# Altium schematic sheet BUCK_unvalidated.SchDoc
size A0; SheetNumber: 2; SheetTotal: 2
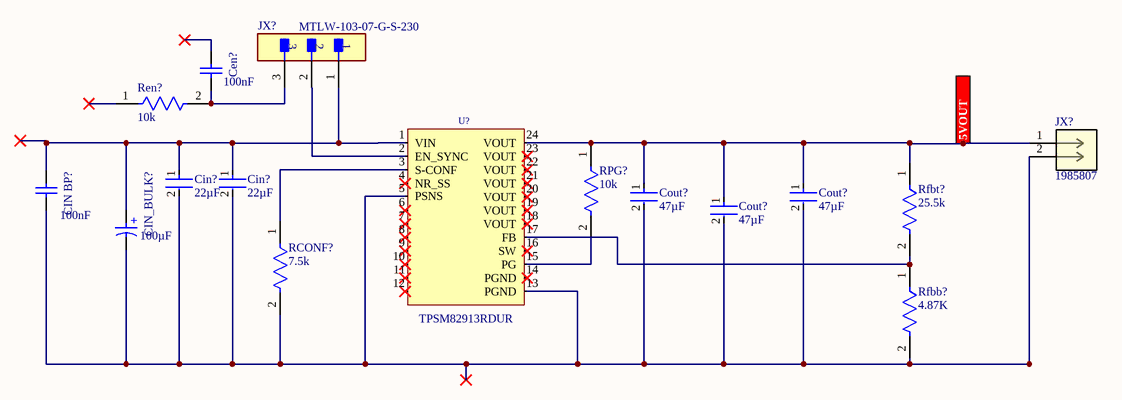
[diagram p0: BUCK_unvalidated.SchDoc]

## Parts
(Parts that share a designator on the sheet are numbered #1, #2 ... from top to bottom, then left to right.)
Cen?  value 100nF  [WCAP-CSGP_0603_L1.6W0.8H0.8_Reflow]  (hidden comment: 885012206095)
Cin?#1  value 22µF  [FP-GRM21B-0_2-e0_2_0_7-MFG]  (hidden comment: GRM21BR61E226ME44L)
Cin?#2  value 22µF  [FP-GRM21B-0_2-e0_2_0_7-MFG]  (hidden comment: GRM21BR61E226ME44L)
CIN_BP?  value 100nF  [WCAP-CSGP_0603_L1.6W0.8H0.8_Reflow]  (hidden comment: 885012206095)
CIN_BULK?  value 100µF  [WCAP-ASLL_D6.3H7.7]  (hidden comment: 865060445005)
Cout?#1  value 47µF  [FP-GRM21B-0_2-e0_2_0_7-MFG]  (hidden comment: GRM21BR61A476ME15L)
Cout?#2  value 47µF  [FP-GRM21B-0_2-e0_2_0_7-MFG]  (hidden comment: GRM21BR61A476ME15L)
Cout?#3  value 47µF  [FP-GRM21B-0_2-e0_2_0_7-MFG]  (hidden comment: GRM21BR61A476ME15L)
JX?#1  MTLW-103-07-G-S-230  [FP-MTLW-103-07-G-S-230-MFG]
JX?#2  1985807  [CONN_1751248_PXC]
RCONF?  value 7.5k  [FP-CRCW0805-HPe3-MFG]  (hidden comment: CRCW08057K50FKEA)
Ren?  value 10k  [FP-CRCW0805-e3-MFG]  (hidden comment: CRCW080510K0FKEA)
Rfbb?  value 4.87K  [FP-CRCW0805-e3-MFG]  (hidden comment: RC0805FR-074K87L)
Rfbt?  value 25.5k  [FP-CRCW0805-e3-MFG]  (hidden comment: CRCW080525K5FKEA)
RPG?  value 10k  [FP-CRCW0805-e3-MFG]  (hidden comment: CRCW080510K0FKEA)
U?  TPSM82913RDUR  [B0QFN28_RDU_TEX]

## Ports
5VOUT

## Nets
5VOUT: Cout?#1.1 Cout?#2.1 Cout?#3.1 JX?#2.1 Rfbt?.1 RPG?.1 U?.24(VOUT) ; port 5VOUT
NetCen?_2: Cen?.2 JX?#1.3 Ren?.2
NetCin?#1_1: Cin?#1.1 Cin?#2.1 CIN_BP?.1 CIN_BULK?.1(P) JX?#1.1 U?.1(VIN)
NetCin?#1_2: Cin?#1.2 CIN_BP?.2 CIN_BULK?.2(N) Cout?#1.2 Cout?#2.2 Cout?#3.2 JX?#2.2 RCONF?.2 Rfbb?.2 U?.5(PSNS) U?.13(PGND)
NetJX?#1_2: JX?#1.2 U?.2(EN_SYNC)
NetRCONF?_1: RCONF?.1 U?.3(S-CONF)
NetRfbb?_1: Rfbb?.1 Rfbt?.2 U?.17(FB)
NetRPG?_2: RPG?.2 U?.15(PG)

Not connected (* = marked no-connect by the designer): Cen? 1*; Cin?#2 2; Ren? 1*; U? 4(NR_SS)* 6* 7* 8* 9* 10* 11* 12* 14(PGND)* 16(SW)* 18(VOUT)* 19(VOUT)* 20(VOUT)* 21(VOUT)* 22(VOUT)* 23(VOUT)*

## Notes on the sheet
- (in symbol CMP-001-00083-1) +

## Library data of the parts
Cen? CIN_BP? = CMP-001-00099-1: Ceramic Capacitor, Multilayer, Ceramic, 50V, 10% +Tol, 10% -Tol, X7R, 15% TC, 0.1uF, Surface Mount, 0603; Voltage Rating: 50V; Min Operating Temperature: -55°C; Mounting Technology: Surface Mount; Case/Package: 0603; Tolerance: 10%; Max Operating Temperature: 125°C
Cin?#1 Cin?#2 = CMP-001-00085-1: 25V 22uF X5R ±20% 0805 Multilayer Ceramic Capacitors MLCC - SMD/SMT ROHS; Tolerance: 20%; Mounting Technology: Surface Mount; Voltage Rating: 25V; Min Operating Temperature: -55°C; Case/Package: 0805; Max Operating Temperature: 85°C
CIN_BULK? = CMP-001-00083-1: WCAP-ASLL Aluminum Electrolytic Capacitors; Voltage Rating: 25V; Ripple Current: 300mA; Min Operating Temperature: -55°C; Case/Package: Radial; Max Operating Temperature: 105°C; Ripple Current (AC): 300mA
Cout?#1-Cout?#3 = CMP-001-00084-1: 10V 47uF X5R ±20% 0805 Multilayer Ceramic Capacitors MLCC - SMD/SMT ROHS; Voltage Rating: 10V; Tolerance: 20%; Min Operating Temperature: -55°C; Mounting Technology: Surface Mount; Case/Package: 0805; Max Operating Temperature: 85°C
JX?#1 = CMP-00030-00005-1: Pin Header, Board-to-Board, 2.54 mm, 1 Rows, 3 Contacts, Through Hole, MTLW Series; Max Operating Temperature: 125°C; Min Operating Temperature: -55°C
JX?#2 = 1985807: PCB terminal block, nominal current: 13.5 A, nom. voltage: 200 V, pitch: 3.5 mm, number of positions: 2, connection method: Screw connection with tension sleeve, mounting: THR soldering, conductor/PCB connection direction: 0 Â°, color: black. This article can be soldered in the reflow furnace together with SMD components.; Manufacturer_Name: Phoenix Contact; Copyright: Copyright (C) 2026 Ultra Librarian. All rights reserved.; Manufacturer_Part_Number: 1985807; RefDes: RefDes; Type: Type
RCONF? = CMP-009-00179-1: Res Hp Thkflm 0805 7.5K Ohm 1% 1/2W 100PPM/ C SMD; Voltage Rating: 150V; Mounting Technology: Surface Mount; Min Operating Temperature: -55°C; Max Operating Temperature: 155°C; Case/Package: 0805; Tolerance: 1%
Ren? RPG? = CMP-009-00186-1: Res Thick Film 0805 10K Ohm 1% 0.125W(1/8W) ±100ppm/C Pad SMD Automotive T/R; Voltage Rating: 150V; Max Operating Temperature: 155°C; Pins: 2; Case/Package: 0805; Min Operating Temperature: -55°C; Tolerance: 1%; Mounting Technology: Surface Mount
Rfbb? = CMP-009-00180-1: Res Thick Film 0805 4.87K Ohm 1%; Voltage Rating: 150V; Mounting Technology: Surface Mount; Case/Package: 0805; Min Operating Temperature: -55°C; Tolerance: 1%; Max Operating Temperature: 155°C; Pins: 2
Rfbt? = CMP-009-00180-1: Res Thick Film 0805 25.5K Ohm 1% 1/8W ±100ppm/°C Molded SMD SMD Paper T/R; Voltage Rating: 150V; Mounting Technology: Surface Mount; Case/Package: 0805; Min Operating Temperature: -55°C; Tolerance: 1%; Max Operating Temperature: 155°C; Pins: 2
U? = CMP-006-00022-2: 17-V VIN, 3-A low-noise and low-ripple buck module with integrated ferrite bead filter compensation 28-B0QFN -40 to 125; Manufacturer_Part_Number: PTPSM82913RDUR; Manufacturer_Name: Texas Instruments; RefDes: RefDes; Design Item ID: PTPSM82913RDUR; Copyright: Copyright (C) 2026 Ultra Librarian. All rights reserved.; Source: PTPSM82913RDUR.SchLib; Type: Type